# Altium schematic sheet 50_RADAR_IO_CAN.SchDoc
size 297 x 209 mm
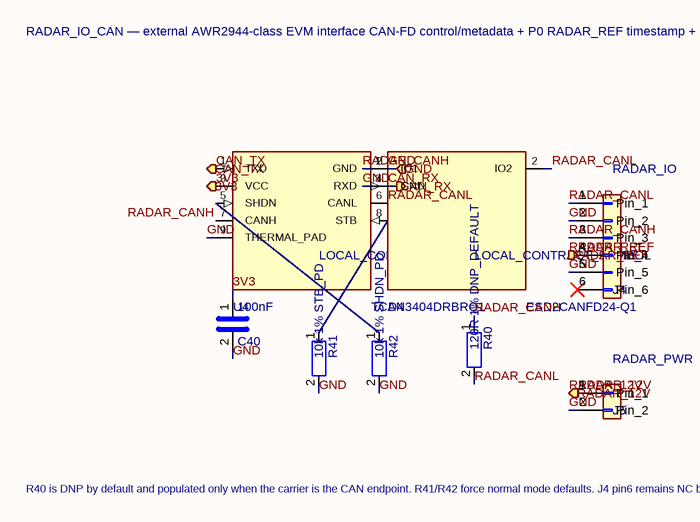
[diagram p0: 50_RADAR_IO_CAN.SchDoc]

## Parts
C40  100nF  [C_0402_1005Metric]
D4  Capture_Status: LOCAL_CONTRACT_SYMBOL  [SOT-23]  (hidden comment: ESD2CANFD24-Q1)
J4  RADAR_IO  [Molex_43045-0600_RA_THT_6P]
J5  RADAR_PWR  [Molex_43650-0200_RA_THT_2P]
R40  120R 1% DNP_DEFAULT  [R_0603_1608Metric]
R41  10k 1% STB_PD  [R_0603_1608Metric]
R42  10k 1% SHDN_PD  [R_0603_1608Metric]
U4  Capture_Status: LOCAL_CONTRACT_SYMBOL  [Texas_DRB0008A]  (hidden comment: TCAN3404DRBRQ1)

## Ports
3V3 (in), CAN_RX (out), CAN_TX (in), GND, RADAR_12V (in), RADAR_REF (out)

## Nets
3V3: C40.1 U4.3(VCC) ; port 3V3
CAN_RX: U4.4(RXD) ; port CAN_RX
CAN_TX: U4.1(TXD) ; port CAN_TX
GND: C40.2 D4.3(GND) J4.2(Pin_2) J4.5(Pin_5) J5.2(Pin_2) R41.2 R42.2 U4.2(GND) U4.9(THERMAL_PAD) ; port GND
RADAR_12V: J5.1(Pin_1) ; port RADAR_12V
RADAR_CANH: D4.1(IO1) J4.3(Pin_3) R40.1 U4.7(CANH)
RADAR_CANL: D4.2(IO2) J4.1(Pin_1) R40.2 U4.6(CANL)
RADAR_REF: J4.4(Pin_4) ; port RADAR_REF
NetR41_1: R41.1 U4.8(STB)
NetR42_1: R42.1 U4.5(SHDN)

Not connected (* = marked no-connect by the designer): J4 6(Pin_6)*

## Notes on the sheet
- RADAR_IO_CAN — external AWR2944-class EVM interface
  CAN-FD control/metadata + P0 RADAR_REF timestamp + protected 12V
- R40 is DNP by default and populated only when the carrier is the CAN endpoint.
  R41/R42 force normal mode defaults. J4 pin6 remains NC by Rev.A contract.
- 1
- 2
- 3
- 4
- 5
- 6
- A
- B
- C
- D
- Title: EVT_SYS_CARRIER
- File: 50_RADAR_IO_CAN.kicad_sch
- Sheet: /
- KiCad E.D.A.  kicad (5.1.4)-1
- Size: A4
- Date:
- Rev:
- Id: 1/1

## Library data of the parts
C40 = C: MPN: 100nF_6.3V_X7R; hierarchy_path: /2c46a14d-5e3e-43a9-b150-1ff871d46d46/57c5fdbf-6eba-4e00-bb02-069cfe24e72f; Value: 100nF; Footprint: Capacitor_SMD:C_0402_1005Metric
D4 = ESD2CANFD24DBZRQ1: hierarchy_path: /2c46a14d-5e3e-43a9-b150-1ff871d46d46/57c5fdbf-6eba-4e00-bb02-069cfe24e72f; MPN: ESD2CANFD24DBZRQ1; Value: ESD2CANFD24-Q1; Footprint: Package_TO_SOT_SMD:SOT-23
J4 = Conn_01x06: MPN: 43045-0600; hierarchy_path: /2c46a14d-5e3e-43a9-b150-1ff871d46d46/57c5fdbf-6eba-4e00-bb02-069cfe24e72f; Value: RADAR_IO; Footprint: SystemCarrier_Altium:Molex_43045-0600_RA_THT_6P
J5 = Conn_01x02: MPN: 43650-0200; hierarchy_path: /2c46a14d-5e3e-43a9-b150-1ff871d46d46/57c5fdbf-6eba-4e00-bb02-069cfe24e72f; Value: RADAR_PWR; Footprint: SystemCarrier_Altium:Molex_43650-0200_RA_THT_2P
R40 = R: MPN: 120R_1%; hierarchy_path: /2c46a14d-5e3e-43a9-b150-1ff871d46d46/57c5fdbf-6eba-4e00-bb02-069cfe24e72f; Value: 120R 1% DNP_DEFAULT; Footprint: Resistor_SMD:R_0603_1608Metric
R41 R42 = R: MPN: 10k_1%; hierarchy_path: /2c46a14d-5e3e-43a9-b150-1ff871d46d46/57c5fdbf-6eba-4e00-bb02-069cfe24e72f; Footprint: Resistor_SMD:R_0603_1608Metric
  R41: Value: 10k 1% STB_PD
  R42: Value: 10k 1% SHDN_PD
U4 = TCAN3404DRBRQ1: hierarchy_path: /2c46a14d-5e3e-43a9-b150-1ff871d46d46/57c5fdbf-6eba-4e00-bb02-069cfe24e72f; MPN: TCAN3404DRBRQ1; Value: TCAN3404DRBRQ1; Footprint: Package_DFN_QFN:Texas_DRB0008A